# Altium schematic sheet BlockDiag.SchDoc
size Letter; SheetNumber: 1; SheetTotal: 15
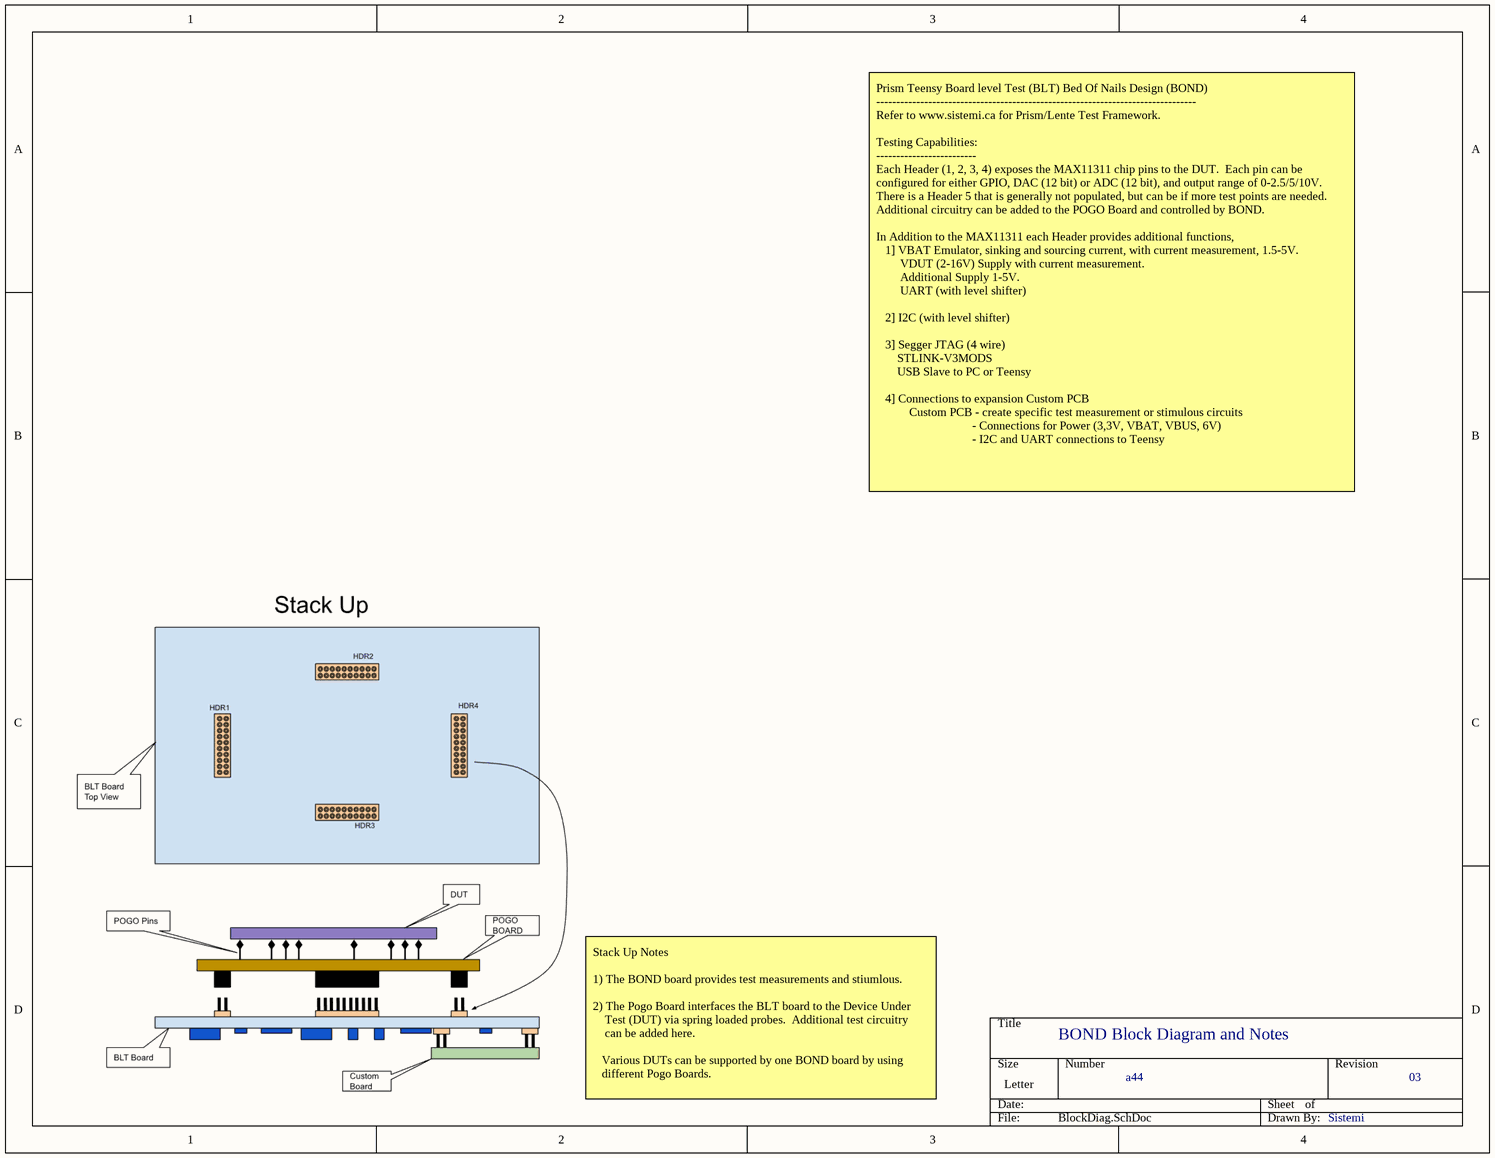
[diagram p0: BlockDiag.SchDoc]

## Notes on the sheet
- Prism Teensy Board level Test (BLT) Bed Of Nails Design (BOND)
  --------------------------------------------------------------------------------
  Refer to www.sistemi.ca for Prism/Lente Test Framework.
  Testing Capabilities:
  -------------------------
  Each Header (1, 2, 3, 4) exposes the MAX11311 chip pins to the DUT.  Each pin can be
  configured for either GPIO, DAC (12 bit) or ADC (12 bit), and output range of 0-2.5/5/10V.
  There is a Header 5 that is generally not populated, but can be if more test points are needed.
  Additional circuitry can be added to the POGO Board and controlled by BOND.
  In Addition to the MAX11311 each Header provides additional functions,
  1] VBAT Emulator, sinking and sourcing current, with current measurement, 1.5-5V.
  VDUT (2-16V) Supply with current measurement.
  Additional Supply 1-5V.
  UART (with level shifter)
  2] I2C (with level shifter)
  3] Segger JTAG (4 wire)
  STLINK-V3MODS
  USB Slave to PC or Teensy
  4] Connections to expansion Custom PCB
  Custom PCB - create specific test measurement or stimulous circuits
  - Connections for Power (3,3V, VBAT, VBUS, 6V)
  - I2C and UART connections to Teensy
- BOND Block Diagram and Notes
- Stack Up Notes
  1) The BOND board provides test measurements and stiumlous.
  2) The Pogo Board interfaces the BLT board to the Device Under
  Test (DUT) via spring loaded probes.  Additional test circuitry
  can be added here.
  Various DUTs can be supported by one BOND board by using
  different Pogo Boards.
- a44
- 03
- Sistemi